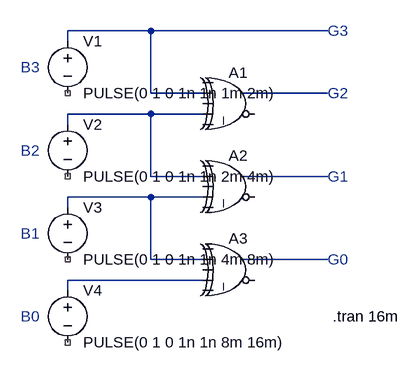
[diagram p0: schematic BCDtoGC.asc]
BCDtoGC.asc, the LTspice schematic file:
Version 4.1
SHEET 1 880 680
WIRE 144 0 16 0
WIRE 416 0 144 0
WIRE 16 16 16 0
WIRE 144 96 144 0
WIRE 224 96 144 96
WIRE 416 96 288 96
WIRE 144 128 16 128
WIRE 224 128 144 128
WIRE 16 144 16 128
WIRE 144 224 144 128
WIRE 224 224 144 224
WIRE 416 224 288 224
WIRE 144 256 16 256
WIRE 224 256 144 256
WIRE 16 272 16 256
WIRE 144 352 144 256
WIRE 224 352 144 352
WIRE 416 352 288 352
WIRE 224 384 16 384
WIRE 16 400 16 384
SYMBOL voltage 16 0 R0
WINDOW 123 0 0 Left 0
WINDOW 39 0 0 Left 0
SYMATTR InstName V1
SYMATTR Value PULSE(0 1 0 1n 1n 1m 2m)
SYMBOL voltage 16 128 R0
WINDOW 123 0 0 Left 0
WINDOW 39 0 0 Left 0
SYMATTR InstName V2
SYMATTR Value PULSE(0 1 0 1n 1n 2m 4m)
SYMBOL voltage 16 256 R0
WINDOW 123 0 0 Left 0
WINDOW 39 0 0 Left 0
SYMATTR InstName V3
SYMATTR Value PULSE(0 1 0 1n 1n 4m 8m)
SYMBOL voltage 16 384 R0
WINDOW 123 0 0 Left 0
WINDOW 39 0 0 Left 0
SYMATTR InstName V4
SYMATTR Value PULSE(0 1 0 1n 1n 8m 16m)
SYMBOL Digital\\xor 272 48 R0
SYMATTR InstName A1
SYMBOL Digital\\xor 272 176 R0
SYMATTR InstName A2
SYMBOL Digital\\xor 272 304 R0
SYMATTR InstName A3
TEXT -56 56 Left 2 ;B3
TEXT -56 184 Left 2 ;B2
TEXT -56 312 Left 2 ;B1
TEXT -56 440 Left 2 ;B0
TEXT 416 96 Left 2 ;G2
TEXT 416 224 Left 2 ;G1
TEXT 416 352 Left 2 ;G0
TEXT 416 0 Left 2 ;G3
TEXT 424 440 Left 2 !.tran 16m

The netlist it stands for:
* BCDtoGC.asc
V1 N001 NC_01 PULSE(0 1 0 1n 1n 1m 2m)
V2 N003 NC_02 PULSE(0 1 0 1n 1n 2m 4m)
V3 N005 NC_03 PULSE(0 1 0 1n 1n 4m 8m)
V4 N007 NC_04 PULSE(0 1 0 1n 1n 8m 16m)
A1 0 N001 0 N003 0 0 N002 0 XOR
A2 0 N003 0 N005 0 0 N004 0 XOR
A3 0 N005 0 N007 0 0 N006 0 XOR
* B3
* B2
* B1
* B0
* G2
* G1
* G0
* G3
.tran 16m
.backanno
.end